# Altium schematic sheet AnalogBoard.SchDoc
size A4
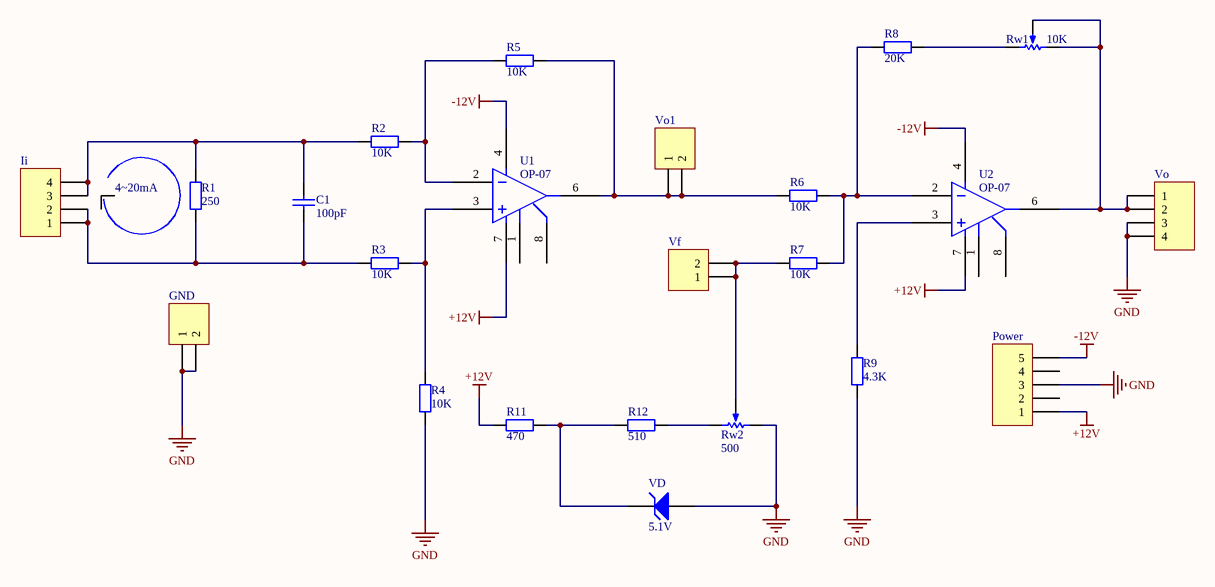
[diagram p0: AnalogBoard.SchDoc]

## Parts
C1  100pF  [RAD0.2]
GND  Header 2  [SIP-2]  (value not drawn)
Ii  Header 4  [SIP-4]  (value not drawn)
Power  Header 5  [POWER PLUG5]  (value not drawn)
R1  250  [AXIAL-0.4]
R2  10K  [AXIAL-0.4]
R3  10K  [AXIAL-0.4]
R4  10K  [AXIAL-0.4]
R5  10K  [AXIAL-0.4]
R6  10K  [AXIAL-0.4]
R7  10K  [AXIAL-0.4]
R8  20K  [AXIAL-0.4]
R9  4.3K  [AXIAL-0.4]
R11  470  [AXIAL-0.4]
R12  510  [AXIAL-0.4]
Rw1  value 10K  [VR5]  (hidden comment: RPot)
Rw2  value 500  [VR5]  (hidden comment: RPot)
U1  OP-07  [DIP-8]
U2  OP-07  [DIP-8]
VD  5.1V  [DIODE0.4]
Vf  Header 2  [SIP-2]  (value not drawn)
Vo  Header 4  [SIP-4]  (value not drawn)
Vo1  Header 2  [SIP-2]  (value not drawn)

## Nets
+12V: Power.1 R11.1 U1.7 U2.7
-12V: Power.5 U1.4 U2.4
GND: GND.1 GND.2 Power.3 R4.2 R9.1 Rw2.1(TOP) VD.1(A) Vo.3 Vo.4
NetC1_1: C1.1 Ii.1 Ii.2 R1.1 R3.2
NetC1_2: C1.2 Ii.3 Ii.4 R1.2 R2.2
NetR2_1: R2.1 R5.1 U1.2
NetR3_1: R3.1 R4.1 U1.3
NetR5_2: R5.2 R6.1 U1.6 Vo1.1 Vo1.2
NetR6_2: R6.2 R7.2 R8.1 U2.2
NetR7_1: R7.1 Rw2.2(TAP) Vf.1 Vf.2
NetR8_2: R8.2 Rw1.3(BOT)
NetR9_2: R9.2 U2.3
NetR11_2: R11.2 R12.1 VD.2(K)
NetR12_2: R12.2 Rw2.3(BOT)
NetRw1_1: Rw1.1(TOP) Rw1.2(TAP) U2.6 Vo.1 Vo.2

Not connected (* = marked no-connect by the designer): Power 2 4; U1 1 8; U2 1 8

## Notes on the sheet
- 4~20mA

## Library data of the parts
C1 = Cap: Capacitor; Published: 8-Jun-2000; LatestRevisionDate: 17-Jul-2002; LatestRevisionNote: Re-released for DXP Platform.; PackageReference: RAD-0.3; Publisher: Altium Limited; Value: 100pF
GND Vf Vo1 = Header 2: Header, 2-Pin; LatestRevisionDate: 17-Jul-2002; LatestRevisionNote: Re-released for DXP Platform.; Publisher: Altium Limited
Ii Vo = Header 4: Header, 4-Pin; LatestRevisionDate: 17-Jul-2002; LatestRevisionNote: Re-released for DXP Platform.; Publisher: Altium Limited
Power = Header 5: Header, 5-Pin; LatestRevisionDate: 17-Jul-2002; LatestRevisionNote: Re-released for DXP Platform.; Publisher: Altium Limited
R1-R9 R11 R12 = Res2: Resistor; Published: 8-Jun-2000; LatestRevisionDate: 17-Jul-2002; LatestRevisionNote: Re-released for DXP Platform.; PackageReference: AXIAL-0.4; Publisher: Altium Limited
  R1: Value: 250
  R2-R7: Value: 10K
  R8: Value: 20K
  R9: Value: 4.3K
  R11: Value: 470
  R12: Value: 510
Rw1 Rw2 = RPot: Potentiometer; Sim Note: Enter the Resistance value and the set point into parameter fields.; Set Position: 0.5; Published: 8-Jun-2000; LatestRevisionDate: 17-Jul-2002; LatestRevisionNote: Re-released for DXP Platform.; PackageReference: VR5; Publisher: Altium Limited
VD = D Zener: Zener Diode; Published: 8-Jun-2000; LatestRevisionDate: 17-Jul-2002; LatestRevisionNote: Re-released for DXP Platform.; PackageReference: DIODE-0.7; Publisher: Altium Limited